# Altium schematic sheet Driver_2.SchDoc
size A; SheetNumber: 5; SheetTotal: 7
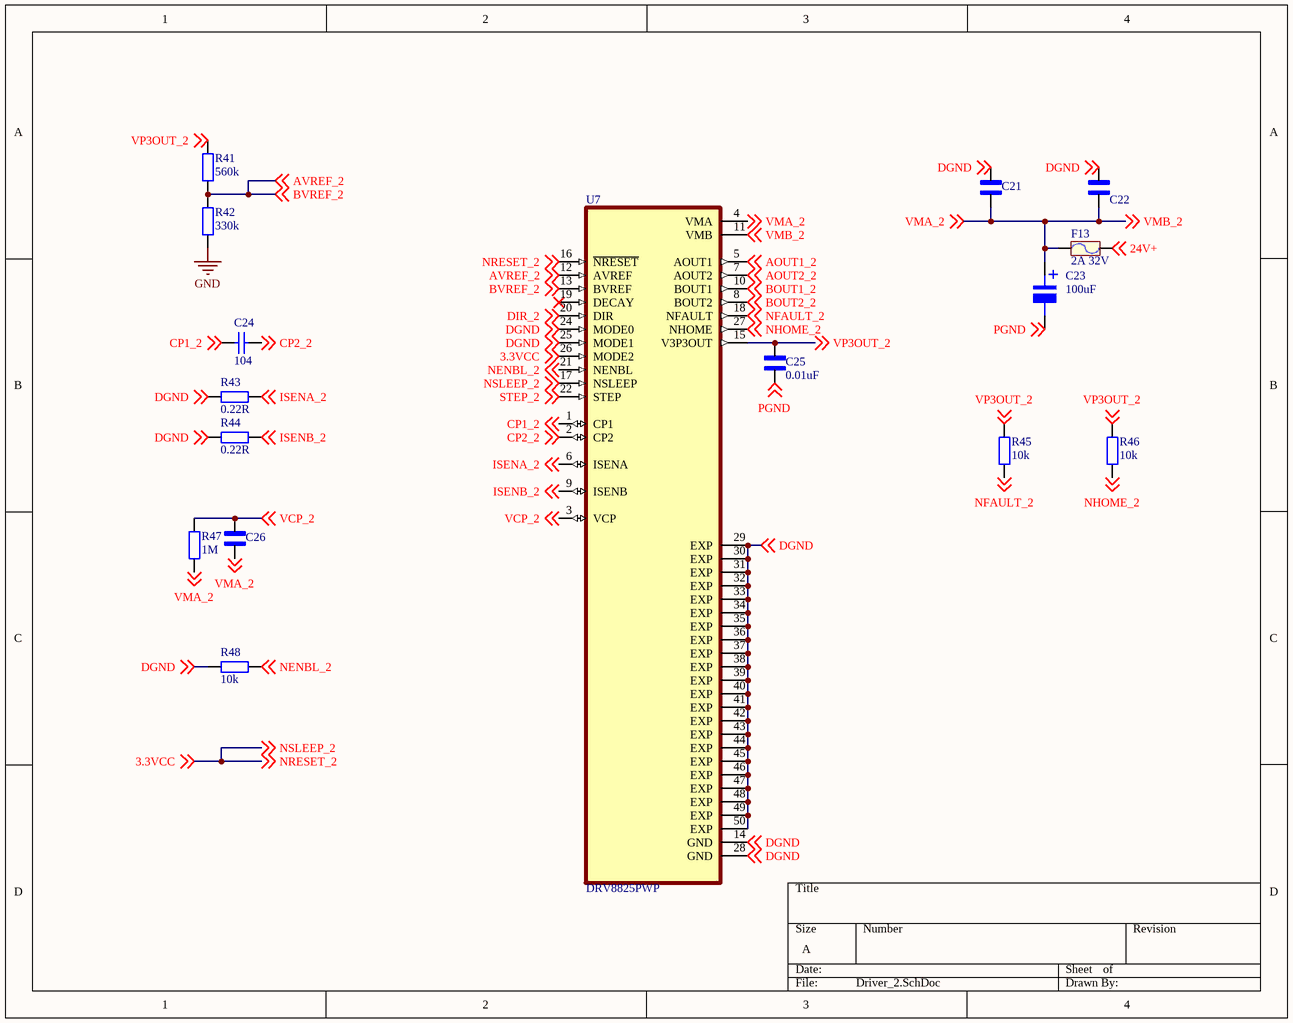
[diagram p0: Driver_2.SchDoc]

## Parts
C21  C0402C104K3RACTU  [CAPC1005X55N]  (value not drawn)
C22  C0402C104K3RACTU  [CAPC1005X55N]  (value not drawn)
C23  100uF  [tu nhom 6.3 (d)]
C24  104  [tu 1206]
C25  0.01uF  [CAPC1608X90N]
C26  C0402C104K3RACTU  [CAPC1005X55N]  (value not drawn)
F13  2A 32V  [Cau chi tu phuc hoi 2A 24V SMD1812]
R41  560k  [Tro SMD 0805]
R42  330k  [Tro SMD 0805]
R43  0.22R  [tro smd 0805]
R44  0.22R  [tro smd 0805]
R45  10k  [tro smd 0805]
R46  10k  [tro smd 0805]
R47  1M  [tro smd 0805]
R48  10k  [tro smd 0805]
U7  DRV8825PWP  [IC_TPS61196PWPRQ1]

## Nets
GND: R42.1
3.3VCC: U7.16(~{NRESET}) U7.17(NSLEEP) U7.26(MODE2) ; off-sheet 3.3VCC, off-sheet NRESET_2, off-sheet NSLEEP_2  [also labelled NRESET_2, NSLEEP_2]
24V+: F13.2 ; off-sheet 24V+
AOUT1_2: U7.5(AOUT1) ; off-sheet AOUT1_2
AOUT2_2: U7.7(AOUT2) ; off-sheet AOUT2_2
AVREF_2: R41.1 R42.2 U7.12(AVREF) U7.13(BVREF) ; off-sheet AVREF_2, off-sheet BVREF_2  [also labelled BVREF_2]
BOUT1_2: U7.10(BOUT1) ; off-sheet BOUT1_2
BOUT2_2: U7.8(BOUT2) ; off-sheet BOUT2_2
CP1_2: C24.1 U7.1(CP1) ; off-sheet CP1_2
CP2_2: C24.2 U7.2(CP2) ; off-sheet CP2_2
DGND: C21.2 C22.2 R43.1 R44.1 R48.1 U7.14(GND) U7.24(MODE0) U7.25(MODE1) U7.28(GND) U7.29(EXP) U7.30(EXP) U7.31(EXP) U7.32(EXP) U7.33(EXP) U7.34(EXP) U7.35(EXP) U7.36(EXP) U7.37(EXP) U7.38(EXP) U7.39(EXP) U7.40(EXP) U7.41(EXP) U7.42(EXP) U7.43(EXP) U7.44(EXP) U7.45(EXP) U7.46(EXP) U7.47(EXP) U7.48(EXP) U7.49(EXP) U7.50(EXP) ; off-sheet DGND
DIR_2: U7.20(DIR) ; off-sheet DIR_2
ISENA_2: R43.2 U7.6(ISENA) ; off-sheet ISENA_2
ISENB_2: R44.2 U7.9(ISENB) ; off-sheet ISENB_2
NENBL_2: R48.2 U7.21(NENBL) ; off-sheet NENBL_2
NFAULT_2: R45.1 U7.18(NFAULT) ; off-sheet NFAULT_2
NHOME_2: R46.1 U7.27(NHOME) ; off-sheet NHOME_2
PGND: C23.2 C25.1 ; off-sheet PGND
STEP_2: U7.22(STEP) ; off-sheet STEP_2
VCP_2: C26.2 R47.2 U7.3(VCP) ; off-sheet VCP_2
VMA_2: C21.1 C22.1 C23.1 C26.1 F13.1 R47.1 U7.4(VMA) U7.11(VMB) ; off-sheet VMA_2, off-sheet VMB_2  [also labelled VMB_2]
VP3OUT_2: C25.2 R41.2 R45.2 R46.2 U7.15(V3P3OUT) ; off-sheet VP3OUT_2

Not connected (* = marked no-connect by the designer): U7 19(DECAY)*

## Notes on the sheet
- (in symbol Tu Nhom 100uF 16V) +

## Library data of the parts
C21 C22 C26 = C0402C104K3RACTU: MF: {'manufacturer': u'KEMET'}; Package: None; Price: None; Value: *; MP: C0402C104K3RACTU; Availability: Unavailable
C23 = Tu Nhom 100uF 16V: Dán; Don_Vi: Con; So_Chan: 2; Ten_Linh_Kien: Tụ Nhôm 100uF 16V 6.3x5.4MM; Ma_Hang: MH002219; Chung_Loai: Dán; Kieu_Chan: *
C24 = Tu 1206 104 50V 20%: Dán; Don_Vi: Con; So_Chan: 2; Ten_Linh_Kien: Tụ 1206 104-0.1uF 20% 50V; Ma_Hang: MH004544; Chung_Loai: Dán; Kieu_Chan: *
C25 = GCE188R72A103KA01D: 0603 0.01 uF 100 V Â±10% Tolerance X7R Multilayer Ceramic Capacitor; MF: Murata; Package: 1608 Murata; Check_prices: https://www.snapeda.com/parts/GCE188R72A103KA01D/Murata%20Electronics%20North%20America/view-part/1764845/?ref=eda; Value: *; Price: None; Purchase-URL: https://pricing.snapeda.com/search/part/GCE188R72A103KA01D/?ref=eda; MP: GCE188R72A103KA01D; Availability: Good; SnapEDA_Link: https://www.snapeda.com/parts/GCE188R72A103KA01D/Murata%20Electronics%20North%20America/view-part/1764845/?ref=snap
F13 = Cau chi tu phuc hoi 2A 24V SMD1812: 2A 24V SMD1812; Ma_Hang: MH010033; Ten: Cầu Chì Tự Phục Hồi 2A 24V SMD1812
R41 = Tro 0805 5% 560k: Dán; Don_Vi: Con; Ma_Hang: MH005342; Ten_Linh_Kien: Trở 0805 5% 560k; So_Chan: 2; Chung_Loai: Dán; Kieu_Chan: *
R42 = Tro 0805 5% 330k: Dán; Don_Vi: Con; So_Chan: 2; Ten_Linh_Kien: Trở 0805 5% 330K; Ma_Hang: MH005336; Chung_Loai: Dán; Kieu_Chan: *
R43 R44 = Tro 0805 1% 0.22R: Dán; Don_Vi: Con; So_Chan: 2; Ten_Linh_Kien: Trở 0805 1% 0.22R; Ma_Hang: MH005466; Chung_Loai: Dán; Kieu_Chan: *
R45 R46 R48 = Tro 0805 1% 10k: Dán; Don_Vi: Con; So_Chan: 2; Ten_Linh_Kien: Trở 0805 1% 10k; Ma_Hang: MH005473; Chung_Loai: Dán; Kieu_Chan: *
R47 = Tro 0805 1% 1M: Dán; Don_Vi: Con; So_Chan: 2; Ten_Linh_Kien: Trở 0805 1% 1M; Ma_Hang: MH005469; Chung_Loai: Dán; Kieu_Chan: *
U7 = DRV8825PWP: <a href="https://snapeda.com/parts/DRV8825PWP/Texas%20Instruments/view-part/?ref=eda">Buy Part</a>; Package: None; Availability: Unavailable; Value: *; MP: DRV8825PWP; Price: None